# Altium project power-board.PrjPcb
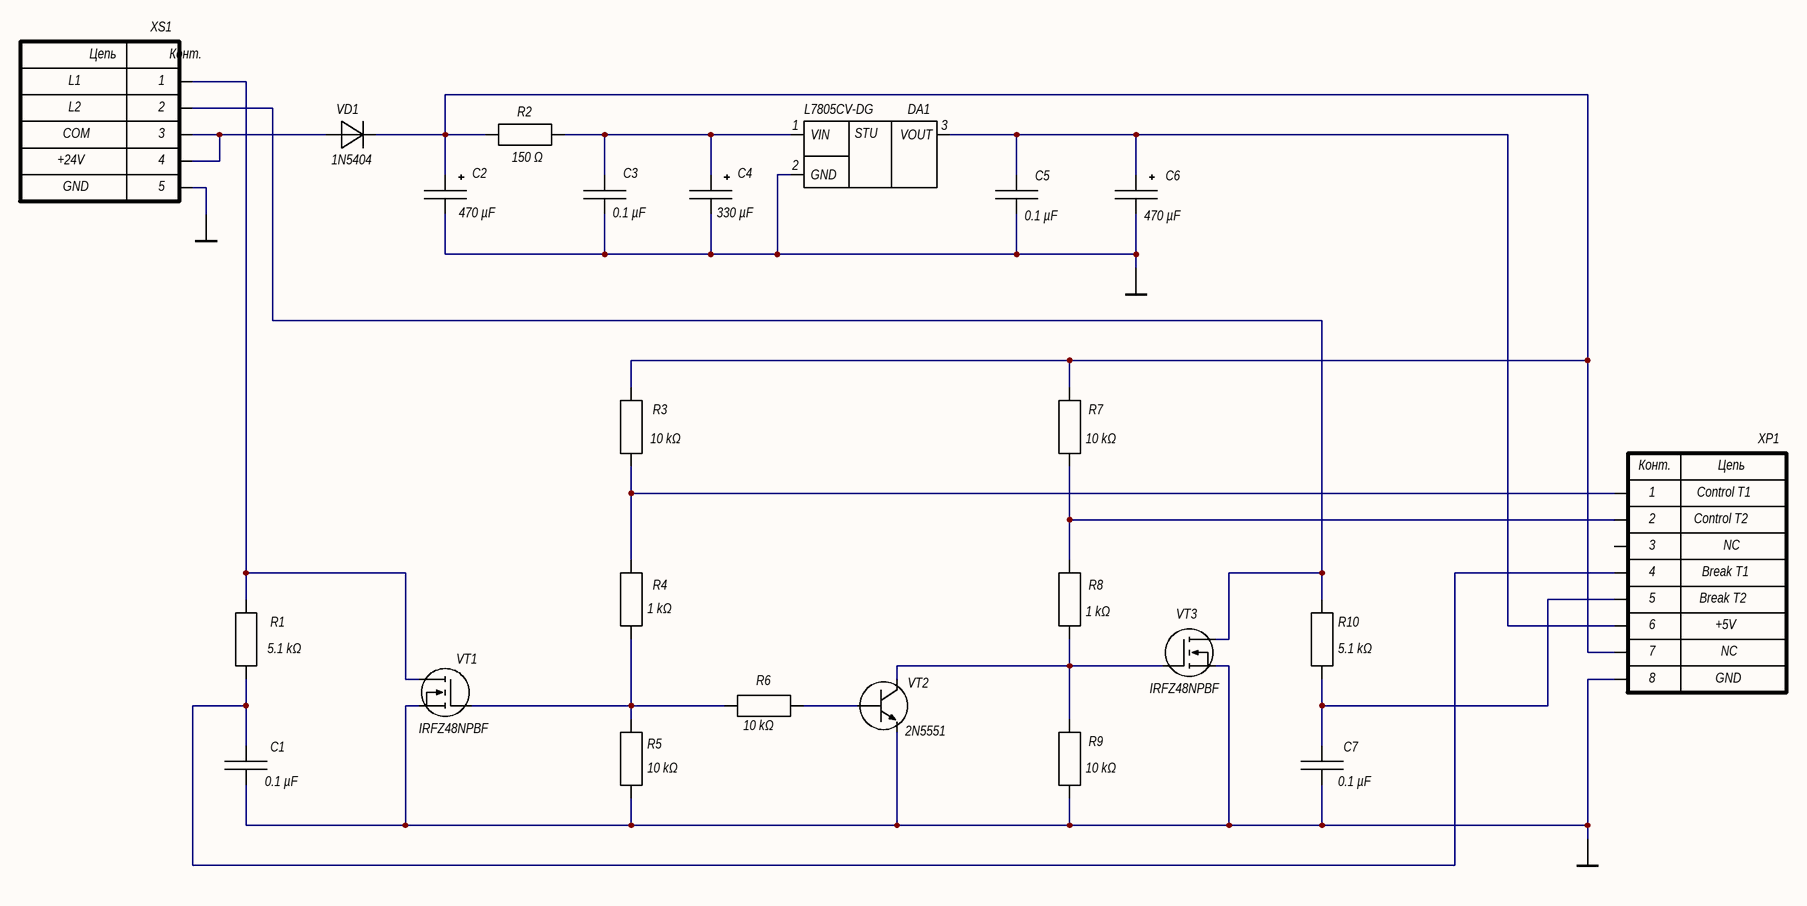
[diagram p0: power-board_E3_schematic.SchDoc]
1 sheet, 24 parts. Net scope: global (net labels, ports and power ports of the same name join across sheets).
Board file: power-board.PcbDoc

## Sheet power-board_E3_schematic.SchDoc: Силовая
size 420 x 297 mm; Author: Советников М.; Organization: ООО "Аксима"; DocumentNumber: Э3; SheetNumber: 1; SheetTotal: 1; Title2str: плата; SheetType: Схема электрическая принципиальная

### Parts
C1  0.1 µF  [C_MLCC]
C2  470 µF  [C_Polarized_D10_H16.5]
C3  0.1 µF  [C_MLCC]
C4  330 µF  [C_Polarized_D8_H16.5]
C5  0.1 µF  [C_MLCC]
C6  470 µF  [C_Polarized_D8_H13]
C7  0.1 µF  [C_MLCC]
DA1  L7805CV-DG  [DA_TO-220]
R1  5.1 kΩ  [R_CF-25_C1-4]
R2  150 Ω  [R_C2-23]
R3  10 kΩ  [R_CF-25_C1-4]
R4  1 kΩ  [R_CF-25_C1-4]
R5  10 kΩ  [R_CF-25_C1-4]
R6  10 kΩ  [R_CF-25_C1-4]
R7  10 kΩ  [R_CF-25_C1-4]
R8  1 kΩ  [R_CF-25_C1-4]
R9  10 kΩ  [R_CF-25_C1-4]
R10  5.1 kΩ  [R_CF-25_C1-4]
VD1  1N5404  [VD_DO-201AD]
VT1  IRFZ48NPBF  [VT_TO-220AB]
VT2  2N5551  [VT_TO-92]
VT3  IRFZ48NPBF  [VT_TO-220AB]
XP1  L-KLS1-2.50-08-R  [X_CWF-8R]  (value not drawn)
XS1  DG35C-B-05P-13-200A(H)  [X_DG35C-05PIN]  (value not drawn)

### Nets
GND: C1.1 C2.2(-) C3.1 C4.2(-) C5.1 C6.2(-) C7.1 DA1.2(GND) R5.1 R9.2 VT1.1(И) VT2.3(Э) VT3.1(И) XP1.8 XS1.5
NetC1_2: C1.2 R1.2 XP1.4
NetC2_1: C2.1(+) R2.1 R3.2 R7.2 VD1.2 XP1.7
NetC3_2: C3.2 C4.1(+) DA1.1(VIN) R2.2
NetC5_2: C5.2 C6.1(+) DA1.3(VOUT) XP1.6
NetC7_2: C7.2 R10.2 XP1.5
NetR1_1: R1.1 VT1.3(С) XS1.1
NetR3_1: R3.1 R4.2 XP1.1
NetR4_1: R4.1 R5.2 R6.2 VT1.2(З)
NetR6_1: R6.1 VT2.2(Б)
NetR7_1: R7.1 R8.2 XP1.2
NetR8_1: R8.1 R9.1 VT2.1(К) VT3.2(З)
NetR10_1: R10.1 VT3.3(С) XS1.2
NetVD1_1: VD1.1 XS1.3 XS1.4

Not connected (* = marked no-connect by the designer): XP1 3

### Notes on the sheet
- L1
- L2
- +24V
- COM
- GND
- Control Т1
- Control Т2
- Break Т1
- NC
- Break Т2
- +5V
- Перв. примен.
- Справ. №
- Подп. и дата
- Инв. № дубл.
- Взам. инв. №
- Разраб.
- Изм.
- Лист
- № докум.
- Подп.
- Дата
- Лит.
- Масса
- Масштаб
- Пров.
- Т.контр.
- Листов
- Инв. № подл.
- Утв.
- Н.контр.
- Копировал
- Формат А3
- (in symbol DA_Voltage_Regulator) STU
- (in symbol XP_Connector_8Pin) Конт.; Цепь
- (in symbol XS_Connector_5Pin) Цепь; Конт.

### Library data of the parts
C1 C3 C5 C7 = C_NonPolarized: Ceramic capacitor, 50 V, 20%; Value: 0.1 µF
C2 C4 = C_Polarized: Aluminum electrolytic capacitor, 35 V, 20%
  C2: Value: 470 µF
  C4: Value: 330 µF
C6 = C_Polarized: Aluminum electrolytic capacitor, 16 V, 20%; Value: 470 µF
DA1 = DA_Voltage_Regulator: Linear voltage regulator, +5 V; Value: L7805CV-DG
R1 R3-R10 = R_Resistor: Resistor, 0.25 W, 5%
  R1 R10: Value: 5.1 kΩ
  R3 R5-R7 R9: Value: 10 kΩ
  R4 R8: Value: 1 kΩ
R2 = R_Resistor: Resistor, 2 W, 5%; Value: 150 Ω
VD1 = VD_Diode: Rectifier diode; Value: 1N5404
VT1 VT3 = VT_MOSFET-N: N-channel MOSFET; Value: IRFZ48NPBF
VT2 = VT_Bipolar-NPN: NPN bipolar transistor; Value: 2N5551
XP1 = XP_Connector_8Pin: 8-position connector; Value: L-KLS1-2.50-08-R
XS1 = XS_Connector_5Pin: 5-position terminal block; Value: DG35C-B-05P-13-200A(H)